# Altium schematic sheet USB_OTG.SchDoc (part 1 of 4)
size A3; SheetNumber: 8; SheetTotal: 18
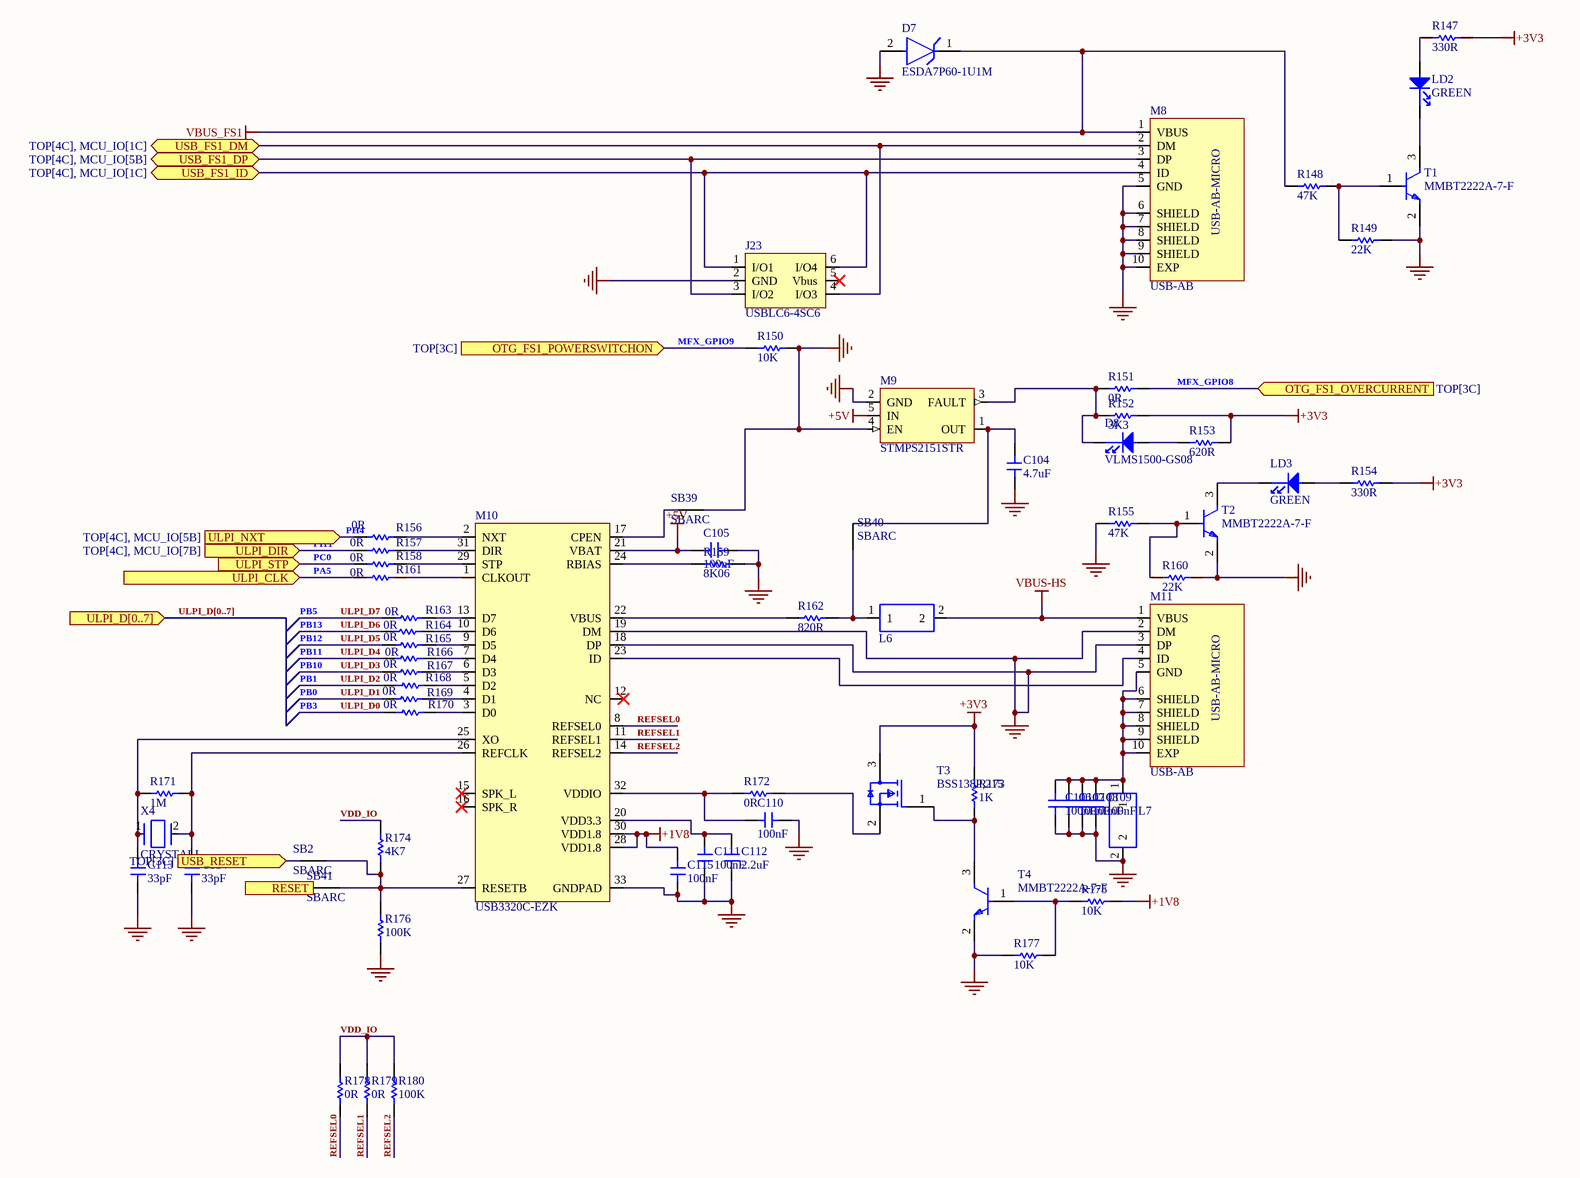
[diagram p0: USB_OTG.SchDoc]

## Parts
C104  4.7uF  [FP-CC0402-IPC_C]
C105  100nF  [FP-CC0402-IPC_C]
C106  100nF  [FP-CC0402-IPC_C]
C107  100nF  [FP-CC0402-IPC_C]
C108  100nF  [FP-CC0402-IPC_C]
C109  100nF  [FP-CC0402-IPC_C]
C110  100nF  [FP-CC0402-IPC_C]
C111  100nF  [FP-CC0402-IPC_C]
C112  2.2uF  [FP-CC0402-IPC_C]
C113  33pF  [FP-CC0402-IPC_C]
C114  33pF  [FP-CC0402-IPC_C]
C115  100nF  [FP-CC0402-IPC_C]
D7  ESDA7P60-1U1M  [FP-1610-MFG]
D8  VLMS1500-GS08  [LEDRED]
J23  USBLC6-4SC6  [SOT23-6L_STM]
L6  FBMJ1608HM180NTR  [BEADC1608X100N]  (value not drawn)
L7  FBMJ1608HM180NTR  [BEADC1608X100N]  (value not drawn)
LD2  GREEN  [LEDGREEN]
LD3  GREEN  [LEDGREEN]
M8  USB-AB  [CONN_1050170001_MOL]
M9  STMPS2151STR  [FP-SOT23-5L-7049676-MFG]
M10  USB3320C-EZK  [QFN32_5X5MC_MCH]
M11  USB-AB  [CONN_1050170001_MOL]
R147  330R  [RESC1608X55X25NL10T15]
R148  47K  [RESC1608X55X25NL10T15]
R149  22K  [RESC1608X55X25NL10T15]
R150  10K  [RESC1608X55X25NL10T15]
R151  0R  [RESC1608X55X25NL10T15]
R152  3K3  [RESC1608X55X25NL10T15]
R153  620R  [RESC1608X55X25NL10T15]
R154  330R  [RESC1608X55X25NL10T15]
R155  47K  [RESC1608X55X25NL10T15]
R156  0R  [RESC1608X55X25NL10T15]
R157  0R  [RESC1608X55X25NL10T15]
R158  0R  [RESC1608X55X25NL10T15]
R159  8K06  [RESC1608X55X25NL10T15]
R160  22K  [RESC1608X55X25NL10T15]
R161  0R  [RESC1608X55X25NL10T15]
R162  820R  [RESC1608X55X25NL10T15]
R163  0R  [RESC1608X55X25NL10T15]
R164  0R  [RESC1608X55X25NL10T15]
R165  0R  [RESC1608X55X25NL10T15]
R166  0R  [RESC1608X55X25NL10T15]
R167  0R  [RESC1608X55X25NL10T15]
R168  0R  [RESC1608X55X25NL10T15]
R169  0R  [RESC1608X55X25NL10T15]
R170  0R  [RESC1608X55X25NL10T15]
R171  1M  [RESC1608X55X25NL10T15]
R172  0R  [RESC1608X55X25NL10T15]
R173  1K  [RESC1608X55X25NL10T15]
R174  4K7  [RESC1608X55X25NL10T15]
R175  10K  [RESC1608X55X25NL10T15]
R176  100K  [RESC1608X55X25NL10T15]
R177  10K  [RESC1608X55X25NL10T15]
R178  0R  [RESC1608X55X25NL10T15]
R179  0R  [RESC1608X55X25NL10T15]
R180  100K  [RESC1608X55X25NL10T15]
SB2  SBARC  [NET_TIE]  (net tie, no BOM)
SB39  SBARC  [NET_TIE]  (net tie, no BOM)
SB40  SBARC  [NET_TIE]  (net tie, no BOM)
SB41  SBARC  [NET_TIE]  (net tie, no BOM)
T1  MMBT2222A-7-F  [FP-SOT23-MFG]
T2  MMBT2222A-7-F  [FP-SOT23-MFG]
T3  BSS138P,215  [FP-SOT23-IPC_A]
T4  MMBT2222A-7-F  [FP-SOT23-MFG]
X4  CRYSTALL  [FP-402-MFG]

## Ports
OTG_FS1_OVERCURRENT (in, see TOP[3C]), OTG_FS1_POWERSWITCHON (in, see TOP[3C]), RESET (in, see TOP[3C], ETHERNET[1B], LCD_CONNECTOR[3B], MFX[1C]), ULPI_CLK (in, see TOP[4C], MCU_IO[2B]), ULPI_D[0..7] (in, see TOP[4C], MCU_IO[1C]), ULPI_DIR (in, see TOP[4C], MCU_IO[7B]), ULPI_NXT (in, see TOP[4C], MCU_IO[5B]), ULPI_STP (in, see TOP[4C], MCU_IO[2B]), USB_FS1_DM (bidir, see TOP[4C], MCU_IO[1C]), USB_FS1_DP (bidir, see TOP[4C], MCU_IO[5B]), USB_FS1_ID (bidir, see TOP[4C], MCU_IO[1C]), USB_RESET (in, see TOP[3C])

## Nets
+1V8: C115.1 M10.28(VDD1.8) M10.30(VDD1.8) R175.2
+3V3: R147.2 R152.2 R153.2 R154.2 R173.1 T3.3(D)
+5V: C105.1 M9.5(IN) M10.21(VBAT)
GND: C104.1 C105.2 C106.2 C107.2 C108.2 C109.2 C110.2 C111.2 C112.2 C113.2 C114.2 C115.2 D7.2(A) J23.2(GND) L7.2 M8.5(GND) M8.6(SHIELD) M8.7(SHIELD) M8.8(SHIELD) M8.9(SHIELD) M8.10(EXP) M9.2(GND) M9.4(EN) M10.18(DP) M10.19(DM) M10.33(GNDPAD) M11.2(DM) M11.3(DP) R149.2 R150.2 R155.1 R159.2 R160.2 R176.2 R177.1 SB39.2 T1.2(E) T2.2(E) T4.2(E)
VBUS-HS: L6.2 M11.1(VBUS)
VBUS_FS1: D7.1(C) M8.1(VBUS) R148.1
MFX_GPIO8: R151.2 ; port OTG_FS1_OVERCURRENT
MFX_GPIO9: R150.1 ; port OTG_FS1_POWERSWITCHON
PA5: R161.1 ; port ULPI_CLK
PB0: R169.1  [also labelled ULPI_D1]
PB1: R168.1  [also labelled ULPI_D2]
PB3: R170.1  [also labelled ULPI_D0]
PB5: R163.1  [also labelled ULPI_D7]
PB10: R167.1  [also labelled ULPI_D3]
PB11: R166.1  [also labelled ULPI_D4]
PB12: R165.1  [also labelled ULPI_D5]
PB13: R164.1  [also labelled ULPI_D6]
PC0: R158.1 ; port ULPI_STP
PH4: R156.1 ; port ULPI_NXT
PI11: R157.1 ; port ULPI_DIR
REFSEL0: M10.8(REFSEL0) R178.2
REFSEL1: M10.11(REFSEL1) R179.2
REFSEL2: M10.14(REFSEL2) R180.2
RESET: SB41.1 ; port RESET
USB_FS1_DM: J23.4(I/O3) M8.2(DM) ; port USB_FS1_DM
USB_FS1_DP: J23.3(I/O2) M8.3(DP) ; port USB_FS1_DP
USB_FS1_ID: J23.1(I/O1) J23.6(I/O4) M8.4(ID) ; port USB_FS1_ID
USB_RESET: SB2.1 ; port USB_RESET
VDD_IO: R174.1 R178.1 R179.1 R180.1
NetC104_2: C104.2 M9.1(OUT) SB40.1
NetC106_1: C106.1 C107.1 C108.1 C109.1 L7.1 M11.5(GND) M11.6(SHIELD) M11.7(SHIELD) M11.8(SHIELD) M11.9(SHIELD) M11.10(EXP)
NetC110_1: C110.1 M10.32(VDDIO) R172.1
NetC111_1: C111.1 C112.1 M10.20(VDD3.3)
NetC113_1: C113.1 M10.25(XO) R171.1 X4.1
NetC114_1: C114.1 M10.26(REFCLK) R171.2 X4.2
NetD8_1: D8.1 M9.3(FAULT) R151.1 R152.1
NetD8_2: D8.2 R153.1
NetL6_1: L6.1 R162.2 SB40.2
NetLD2_1: LD2.1 T1.3(C)
NetLD2_2: LD2.2 R147.1
NetLD3_1: LD3.1 T2.3(C)
NetLD3_2: LD3.2 R154.1
NetM10_1: M10.1(CLKOUT) R161.2
NetM10_2: M10.2(NXT) R156.2
NetM10_3: M10.3(D0) R170.2
NetM10_4: M10.4(D1) R169.2
NetM10_5: M10.5(D2) R168.2
NetM10_6: M10.6(D3) R167.2
NetM10_7: M10.7(D4) R166.2
NetM10_9: M10.9(D5) R165.2
NetM10_10: M10.10(D6) R164.2
NetM10_13: M10.13(D7) R163.2
NetM10_17: M10.17(CPEN) SB39.1
NetM10_22: M10.22(VBUS) R162.1
NetM10_23: M10.23(ID) M11.4(ID)
NetM10_24: M10.24(RBIAS) R159.1
NetM10_27: M10.27(RESETB) R174.2 R176.1 SB2.2 SB41.2
NetM10_29: M10.29(STP) R158.2
NetM10_31: M10.31(DIR) R157.2
NetR148_2: R148.2 R149.1 T1.1(B)
NetR155_2: R155.2 R160.1 T2.1(B)
NetR172_2: R172.2 T3.2(S)
NetR173_2: R173.2 T3.1(G) T4.3(C)
NetR175_1: R175.1 R177.2 T4.1(B)

Not connected (* = marked no-connect by the designer): J23 5(Vbus)*; M10 12(NC)* 15(SPK_L)* 16(SPK_R)*

## Buses and harness runs
bus ULPI_D[0..7] = port ULPI_D[0..7]